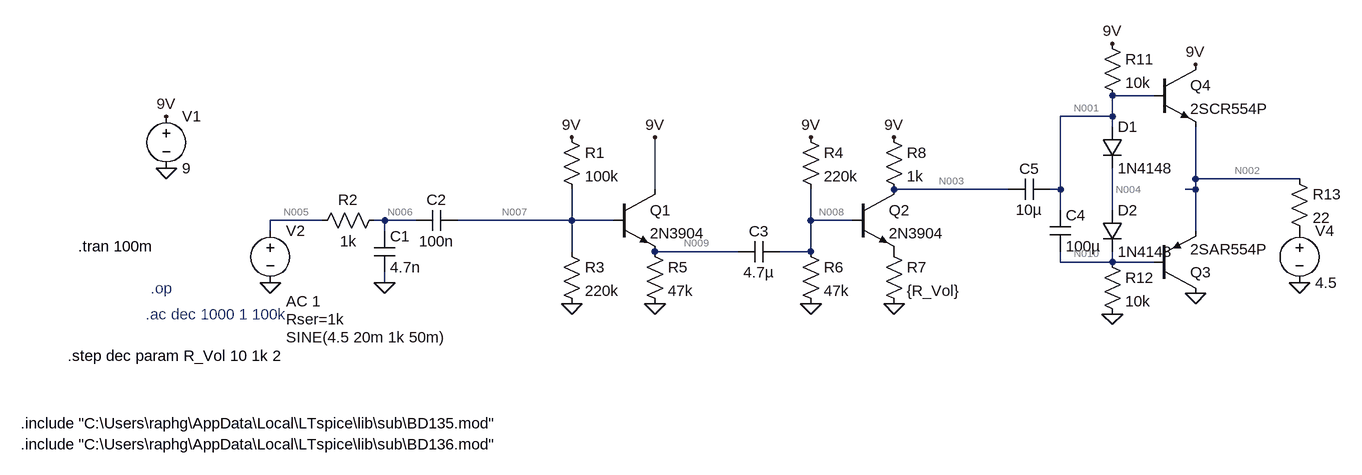
[diagram p0: schematic Draft3.asc]
Draft3.asc, the LTspice schematic file:
Version 4
SHEET 1 1652 680
WIRE 1360 -48 1296 -48
WIRE 1296 -16 1296 -48
WIRE 1296 -16 1216 -16
WIRE 1296 0 1296 -16
WIRE 1424 80 1424 0
WIRE 1584 80 1424 80
WIRE 592 96 592 16
WIRE 1136 96 960 96
WIRE 1216 96 1216 -16
WIRE 1216 96 1200 96
WIRE 1424 96 1424 80
WIRE 1424 96 1408 96
WIRE 1216 128 1216 96
WIRE 1296 128 1296 64
WIRE 80 144 0 144
WIRE 176 144 160 144
WIRE 224 144 176 144
WIRE 464 144 464 96
WIRE 464 144 288 144
WIRE 528 144 464 144
WIRE 832 144 832 96
WIRE 896 144 832 144
WIRE 0 160 0 144
WIRE 176 160 176 144
WIRE 1424 160 1424 96
WIRE 464 192 464 144
WIRE 720 192 592 192
WIRE 832 192 832 144
WIRE 832 192 784 192
WIRE 1216 208 1216 192
WIRE 1296 208 1296 192
WIRE 1296 208 1216 208
WIRE 1360 208 1296 208
WIRE 176 240 176 224
FLAG -160 64 0
FLAG -160 -16 9V
FLAG 0 240 0
FLAG 176 240 0
FLAG 592 272 0
FLAG 464 272 0
FLAG 464 16 9V
FLAG 592 16 9V
FLAG 960 272 0
FLAG 832 272 0
FLAG 832 16 9V
FLAG 960 16 9V
FLAG 1424 256 0
FLAG 1424 -96 9V
FLAG 1296 288 0
FLAG 1296 -128 9V
FLAG 1584 240 0
DATAFLAG 592 64 ""
DATAFLAG 1040 96 ""
DATAFLAG 656 192 ""
DATAFLAG 848 144 ""
SYMBOL voltage -160 -32 R0
WINDOW 123 0 0 Left 0
WINDOW 39 0 0 Left 0
SYMATTR InstName V1
SYMATTR Value 9
SYMBOL voltage 0 144 R0
WINDOW 3 24 180 Left 2
WINDOW 123 24 124 Left 2
WINDOW 39 24 152 Left 2
SYMATTR InstName V2
SYMATTR Value SINE(4.5 20m 1k 50m)
SYMATTR Value2 AC 1
SYMATTR SpiceLine Rser=1k
SYMBOL res 176 128 R90
WINDOW 0 0 56 VBottom 2
WINDOW 3 32 56 VTop 2
SYMATTR InstName R2
SYMATTR Value 1k
SYMBOL cap 160 160 R0
SYMATTR InstName C1
SYMATTR Value 4.7n
SYMBOL npn 528 96 R0
SYMATTR InstName Q1
SYMATTR Value 2N3904
SYMBOL res 448 0 R0
SYMATTR InstName R1
SYMATTR Value 100k
SYMBOL res 448 176 R0
SYMATTR InstName R3
SYMATTR Value 220k
SYMBOL res 576 176 R0
SYMATTR InstName R5
SYMATTR Value 47k
SYMBOL cap 288 128 R90
WINDOW 0 0 32 VBottom 2
WINDOW 3 32 32 VTop 2
SYMATTR InstName C2
SYMATTR Value 100n
SYMBOL cap 784 176 R90
WINDOW 0 0 32 VBottom 2
WINDOW 3 32 32 VTop 2
SYMATTR InstName C3
SYMATTR Value 4.7µ
SYMBOL npn 896 96 R0
SYMATTR InstName Q2
SYMATTR Value 2N3904
SYMBOL res 944 176 R0
SYMATTR InstName R7
SYMATTR Value {R_Vol}
SYMBOL res 944 0 R0
SYMATTR InstName R8
SYMATTR Value 1k
SYMBOL res 816 0 R0
SYMATTR InstName R4
SYMATTR Value 220k
SYMBOL res 816 176 R0
SYMATTR InstName R6
SYMATTR Value 47k
SYMBOL pnp 1360 256 M180
SYMATTR InstName Q3
SYMATTR Value 2SAR554P
SYMBOL npn 1360 -96 R0
SYMATTR InstName Q4
SYMATTR Value 2SCR554P
SYMBOL res 1280 -144 R0
SYMATTR InstName R11
SYMATTR Value 10k
SYMBOL res 1280 192 R0
SYMATTR InstName R12
SYMATTR Value 10k
SYMBOL res 1568 64 R0
SYMATTR InstName R13
SYMATTR Value 22
SYMBOL voltage 1584 144 R0
WINDOW 123 0 0 Left 0
WINDOW 39 0 0 Left 0
SYMATTR InstName V4
SYMATTR Value 4.5
SYMBOL diode 1280 0 R0
SYMATTR InstName D1
SYMATTR Value 1N4148
SYMBOL diode 1280 128 R0
SYMATTR InstName D2
SYMATTR Value 1N4148
SYMBOL cap 1200 128 R0
SYMATTR InstName C4
SYMATTR Value 100µ
SYMBOL cap 1200 80 R90
WINDOW 0 0 32 VBottom 2
WINDOW 3 32 32 VTop 2
SYMATTR InstName C5
SYMATTR Value 10µ
TEXT -192 288 Left 2 ;.ac dec 1000 1 100k
TEXT -184 248 Left 2 ;.op
TEXT -296 184 Left 2 !.tran 100m
TEXT -312 352 Left 2 !.step dec param R_Vol 10 1k 2
TEXT -384 456 Left 2 !.include "C:\\Users\\raphg\\AppData\\Local\\LTspice\\lib\\sub\\BD135.mod"
TEXT -384 488 Left 2 !.include "C:\\Users\\raphg\\AppData\\Local\\LTspice\\lib\\sub\\BD136.mod"

The netlist it stands for:
* Draft3.asc
V1 9V 0 9
V2 N005 0 SINE(4.5 20m 1k 50m) AC 1 Rser=1k
R2 N006 N005 1k
C1 N006 0 4.7n
Q1 9V N007 N009 0 2N3904
R1 9V N007 100k
R3 N007 0 220k
R5 N009 0 47k
C2 N007 N006 100n
C3 N008 N009 4.7µ
Q2 N003 N008 P001 0 2N3904
R7 P001 0 {R_Vol}
R8 9V N003 1k
R4 9V N008 220k
R6 N008 0 47k
Q3 0 N010 N002 0 2SAR554P
Q4 9V N001 N002 0 2SCR554P
R11 9V N001 10k
R12 N010 0 10k
R13 N002 P002 22
V4 P002 0 4.5
D1 N001 N004 1N4148
D2 N004 N010 1N4148
C4 N001 N010 100µ
C5 N001 N003 10µ
.model D D
.lib standard.dio
.model NPN NPN
.model PNP PNP
.lib standard.bjt
* .ac dec 1000 1 100k
* .op
.tran 100m
.step dec param R_Vol 10 1k 2
.include "C:\Users\raphg\AppData\Local\LTspice\lib\sub\BD135.mod"
.include "C:\Users\raphg\AppData\Local\LTspice\lib\sub\BD136.mod"
.backanno
.end

* Results of the author's LTspice run, read from the files saved beside the schematic
* Operating Point (first step), zero values left out:
*   r_vol = 10 
*   V(9v) = 9 V
*   V(n005) = 4.5 V
*   V(n006) = 4.5 V
*   V(n007) = 6.161 V
*   V(n009) = 5.562 V
*   V(n008) = 767.6 mV
*   V(n003) = 2.653 V
*   V(p001) = 63.68 mV
*   V(n010) = 3.958 V
*   V(n002) = 4.501 V
*   V(n001) = 5.042 V
*   V(p002) = 4.5 V
*   V(n004) = 4.5 V
*   Ic(Q1) = 118 µA
*   Ib(Q1) = 382.5 nA
*   Ie(Q1) = -118.3 µA
*   Ic(Q2) = 6.347 mA
*   Ib(Q2) = 21.09 µA
*   Ie(Q2) = -6.368 mA
*   Ic(Q3) = -597.1 µA
*   Ib(Q3) = -2.633 µA
*   Ie(Q3) = 599.7 µA
*   Ic(Q4) = 661.4 µA
*   Ib(Q4) = 2.705 µA
*   Ie(Q4) = -664.1 µA
*   I(D1) = 393.1 µA
*   I(D2) = 393.1 µA
*   I(R1) = 28.39 µA
*   I(R3) = 28.01 µA
*   I(R5) = 118.3 µA
*   I(R7) = 6.368 mA
*   I(R8) = 6.347 mA
*   I(R4) = 37.42 µA
*   I(R6) = 16.33 µA
*   I(R11) = 395.8 µA
*   I(R12) = 395.8 µA
*   I(R13) = 64.4 µA
*   I(V1) = -7.588 mA
*   I(V4) = 64.4 µA
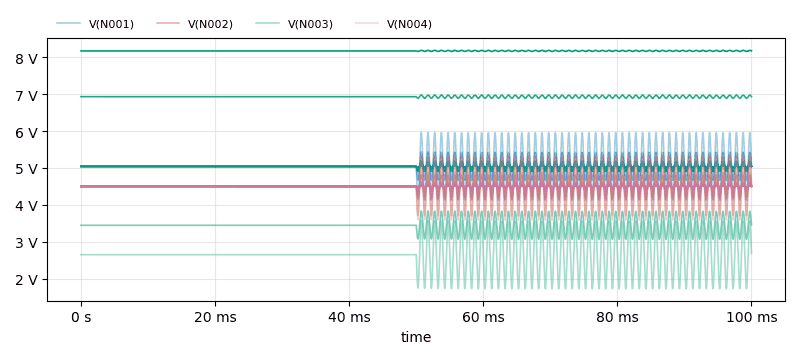
[diagram p1: Transient Analysis of Draft3.asc, plotted from the saved traces]
* Transient Analysis, 5 runs:
*   V(N001) [r_vol=10]: min 4.126 V, max 5.966 V, average 5.047 V, rms 5.067 V, last 5.085 V
*   V(N001) [r_vol=31.6227766016838]: min 4.665 V, max 5.43 V, average 5.043 V, rms 5.047 V, last 5.056 V
*   V(N001) [r_vol=100]: min 4.908 V, max 5.179 V, average 5.042 V, rms 5.043 V, last 5.046 V
*   V(N001) [r_vol=316.227766016838]: min 4.997 V, max 5.087 V, average 5.042 V, rms 5.042 V, last 5.043 V
*   V(N001) [r_vol=1000]: min 5.027 V, max 5.056 V, average 5.042 V, rms 5.042 V, last 5.042 V
*   V(N002) [r_vol=10]: min 3.7 V, max 5.32 V, average 4.508 V, rms 4.525 V, last 4.526 V
*   V(N002) [r_vol=31.6227766016838]: min 4.208 V, max 4.81 V, average 4.504 V, rms 4.506 V, last 4.509 V
*   V(N002) [r_vol=100]: min 4.417 V, max 4.591 V, average 4.502 V, rms 4.502 V, last 4.504 V
*   V(N002) [r_vol=316.227766016838]: min 4.478 V, max 4.526 V, average 4.502 V, rms 4.502 V, last 4.502 V
*   V(N002) [r_vol=1000]: min 4.494 V, max 4.509 V, average 4.501 V, rms 4.501 V, last 4.502 V
*   V(N003) [r_vol=10]: min 1.729 V, max 3.572 V, average 2.654 V, rms 2.693 V, last 2.692 V
*   V(N003) [r_vol=31.6227766016838]: min 3.07 V, max 3.836 V, average 3.449 V, rms 3.455 V, last 3.462 V
*   V(N003) [r_vol=100]: min 4.906 V, max 5.177 V, average 5.04 V, rms 5.041 V, last 5.045 V
*   V(N003) [r_vol=316.227766016838]: min 6.885 V, max 6.975 V, average 6.929 V, rms 6.929 V, last 6.931 V
*   V(N003) [r_vol=1000]: min 8.154 V, max 8.183 V, average 8.168 V, rms 8.168 V, last 8.169 V
*   V(N004) [r_vol=10]: min 3.586 V, max 5.424 V, average 4.506 V, rms 4.529 V, last 4.547 V
*   V(N004) [r_vol=31.6227766016838]: min 4.124 V, max 4.888 V, average 4.502 V, rms 4.506 V, last 4.515 V
*   V(N004) [r_vol=100]: min 4.366 V, max 4.637 V, average 4.5 V, rms 4.501 V, last 4.504 V
*   V(N004) [r_vol=316.227766016838]: min 4.455 V, max 4.545 V, average 4.5 V, rms 4.5 V, last 4.501 V
*   V(N004) [r_vol=1000]: min 4.485 V, max 4.514 V, average 4.5 V, rms 4.5 V, last 4.5 V